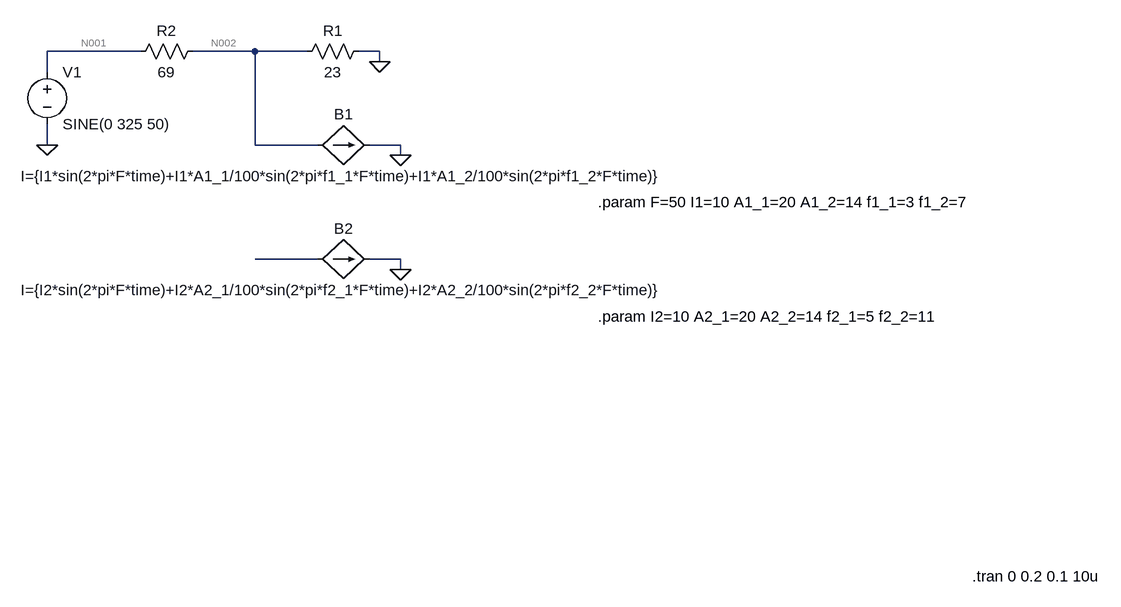
[diagram p0: schematic Multiple harmonics.asc]
Multiple harmonics.asc, the LTspice schematic file:
Version 4.1
SHEET 1 1736 904
WIRE 240 80 96 80
WIRE 416 80 320 80
WIRE 496 80 416 80
WIRE 608 80 576 80
WIRE 608 96 608 80
WIRE 96 112 96 80
WIRE 96 224 96 192
WIRE 416 224 416 80
WIRE 512 224 416 224
WIRE 640 224 592 224
WIRE 640 240 640 224
WIRE 512 400 416 400
WIRE 640 400 592 400
WIRE 640 416 640 400
FLAG 96 224 0
FLAG 608 96 0
FLAG 640 240 0
FLAG 640 416 0
SYMBOL voltage 96 96 R0
WINDOW 123 0 0 Left 0
WINDOW 39 0 0 Left 0
SYMATTR InstName V1
SYMATTR Value SINE(0 325 50)
SYMBOL res 592 64 R90
WINDOW 0 0 56 VBottom 2
WINDOW 3 32 56 VTop 2
SYMATTR InstName R1
SYMATTR Value 23
SYMBOL bi 512 224 R270
WINDOW 0 32 40 VTop 2
WINDOW 3 -32 40 VBottom 2
SYMATTR InstName B1
SYMATTR Value I={I1*sin(2*pi*F*time)+I1*A1_1/100*sin(2*pi*f1_1*F*time)+I1*A1_2/100*sin(2*pi*f1_2*F*time)}
SYMBOL bi 512 400 R270
WINDOW 0 32 40 VTop 2
WINDOW 3 -32 40 VBottom 2
SYMATTR InstName B2
SYMATTR Value I={I2*sin(2*pi*F*time)+I2*A2_1/100*sin(2*pi*f2_1*F*time)+I2*A2_2/100*sin(2*pi*f2_2*F*time)}
SYMBOL res 336 64 R90
WINDOW 0 0 56 VBottom 2
WINDOW 3 32 56 VTop 2
SYMATTR InstName R2
SYMATTR Value 69
TEXT 1520 888 Left 2 !.tran 0 0.2 0.1 10u
TEXT 944 312 Left 2 !.param F=50 I1=10 A1_1=20 A1_2=14 f1_1=3 f1_2=7
TEXT 944 488 Left 2 !.param I2=10 A2_1=20 A2_2=14 f2_1=5 f2_2=11

The netlist it stands for:
* Multiple harmonics.asc
V1 N001 0 SINE(0 325 50)
R1 0 N002 23
B1 N002 0 I={I1*sin(2*pi*F*time)+I1*A1_1/100*sin(2*pi*f1_1*F*time)+I1*A1_2/100*sin(2*pi*f1_2*F*time)}
B2 N003 0 I={I2*sin(2*pi*F*time)+I2*A2_1/100*sin(2*pi*f2_1*F*time)+I2*A2_2/100*sin(2*pi*f2_2*F*time)}
R2 N002 N001 69
.tran 0 0.2 0.1 10u
.param F=50 I1=10 A1_1=20 A1_2=14 f1_1=3 f1_2=7
.param I2=10 A2_1=20 A2_2=14 f2_1=5 f2_2=11
.backanno
.end

* Results of the author's LTspice run, read from the files saved beside the schematic
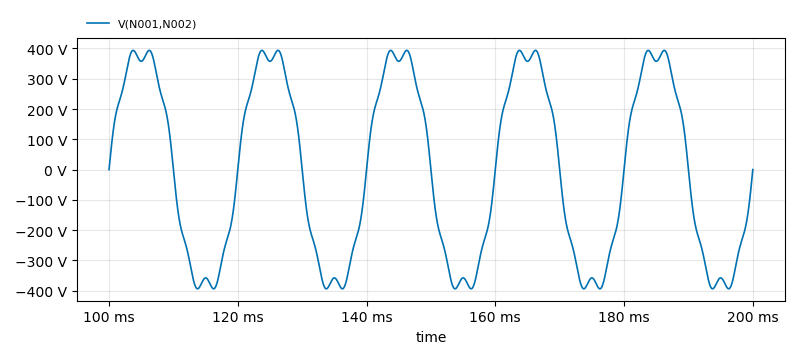
[diagram p1: Transient Analysis of Multiple harmonics.asc, plotted from the saved traces]
* Transient Analysis, 1 run:
*   V(N001,N002): min -393.7 V, max 393.7 V, average 0 V, rms 295.8 V, last 0 V